# Altium schematic sheet STM32.SchDoc
size A4; SheetNumber: 3; SheetTotal: 9
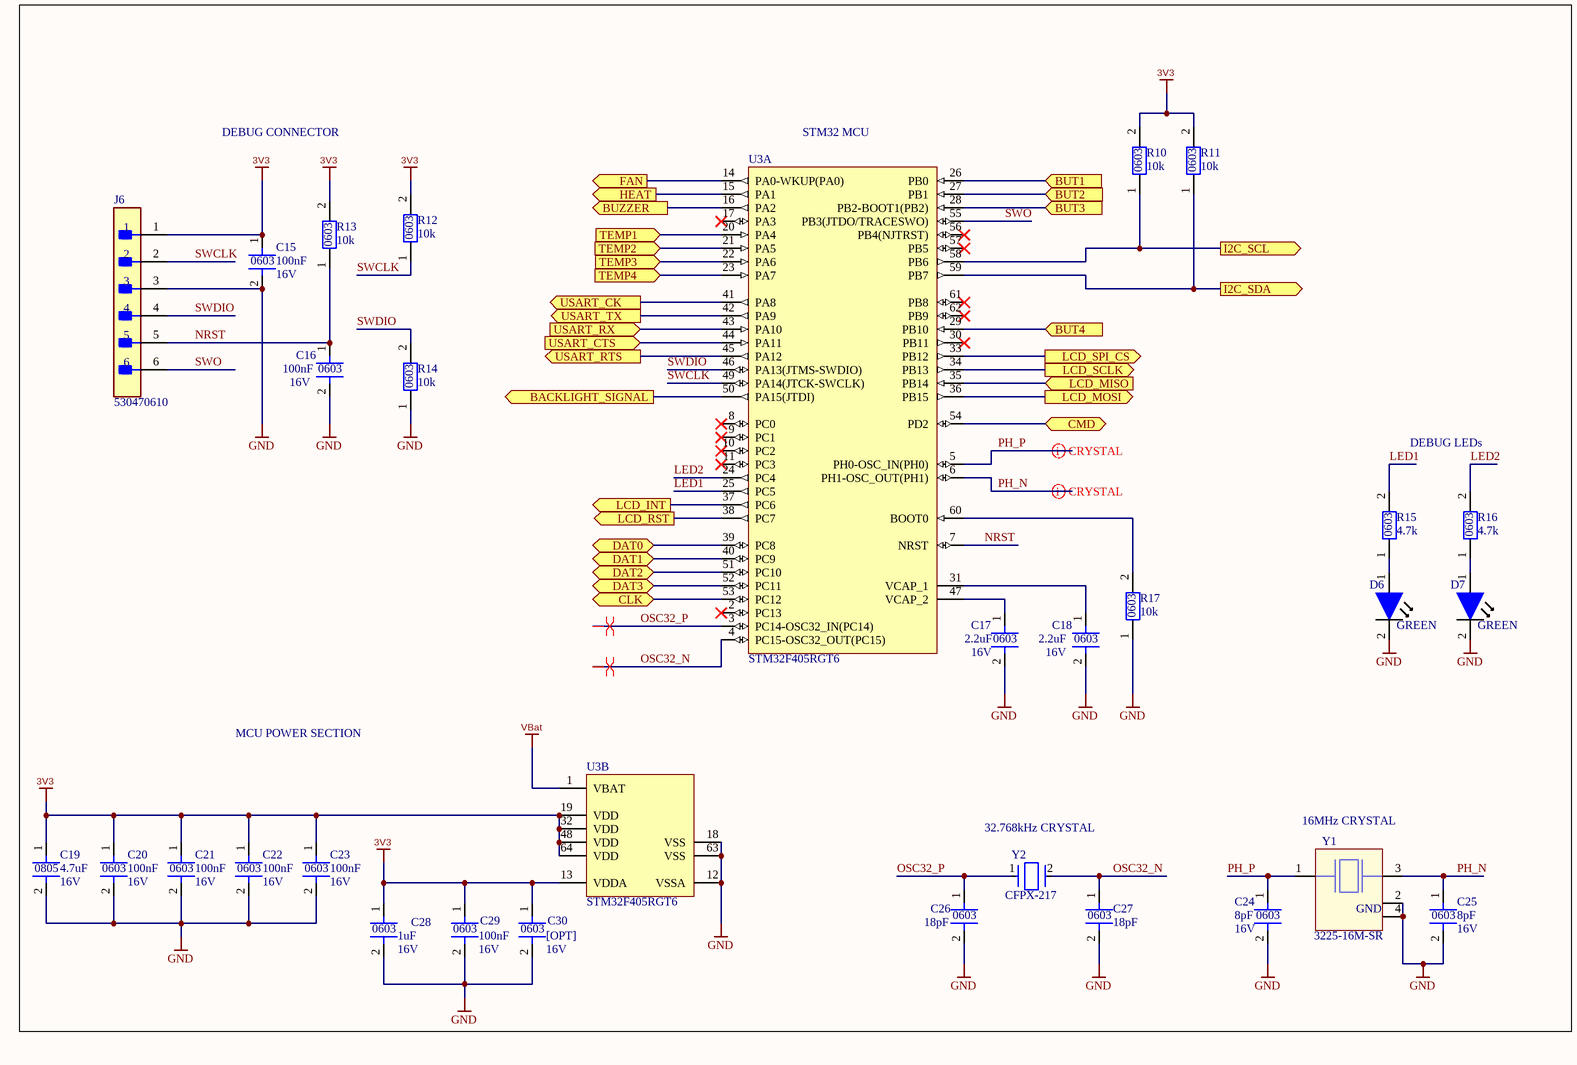
[diagram p0: STM32.SchDoc]

## Parts
C15  SMD 0603 Capacitor  [CAPACITOR_SMD_0603]  (value not drawn)
C16  SMD 0603 Capacitor  [CAPACITOR_SMD_0603]  (value not drawn)
C17  SMD 0603 Capacitor  [CAPACITOR_SMD_0603]  (value not drawn)
C18  SMD 0603 Capacitor  [CAPACITOR_SMD_0603]  (value not drawn)
C19  SMD 0805 Capacitor  [CAPACITOR_SMD_0805_IPC]  (value not drawn)
C20  SMD 0603 Capacitor  [CAPACITOR_SMD_0603]  (value not drawn)
C21  SMD 0603 Capacitor  [CAPACITOR_SMD_0603]  (value not drawn)
C22  SMD 0603 Capacitor  [CAPACITOR_SMD_0603]  (value not drawn)
C23  SMD 0603 Capacitor  [CAPACITOR_SMD_0603]  (value not drawn)
C24  SMD 0603 Capacitor  [CAPACITOR_SMD_0603]  (value not drawn)
C25  SMD 0603 Capacitor  [CAPACITOR_SMD_0603]  (value not drawn)
C26  SMD 0603 Capacitor  [CAPACITOR_SMD_0603]  (value not drawn)
C27  SMD 0603 Capacitor  [CAPACITOR_SMD_0603]  (value not drawn)
C28  SMD 0603 Capacitor  [CAPACITOR_SMD_0603]  (value not drawn)
C29  SMD 0603 Capacitor  [CAPACITOR_SMD_0603]  (value not drawn)
C30  SMD 0603 Capacitor  [CAPACITOR_SMD_0603]  (value not drawn)
D6  SMD LED 0603  [0603 LED]  (value not drawn)
D7  SMD LED 0603  [0603 LED]  (value not drawn)
J6  530470610  [FP-530470610-MFG]
R10  SMD 0603 Resistor  [RESISTOR_SMD_0603]  (value not drawn)
R11  SMD 0603 Resistor  [RESISTOR_SMD_0603]  (value not drawn)
R12  SMD 0603 Resistor  [RESISTOR_SMD_0603]  (value not drawn)
R13  SMD 0603 Resistor  [RESISTOR_SMD_0603]  (value not drawn)
R14  SMD 0603 Resistor  [RESISTOR_SMD_0603]  (value not drawn)
R15  SMD 0603 Resistor  [RESISTOR_SMD_0603]  (value not drawn)
R16  SMD 0603 Resistor  [RESISTOR_SMD_0603]  (value not drawn)
R17  SMD 0603 Resistor  [RESISTOR_SMD_0603]  (value not drawn)
U3  STM32F405RGT6  [STM-LQFP64_V]  (parts A,B of 2)
Y1  3225-16M-SR  [3225-16M-SR]
Y2  CFPX-217  [FP-ABS07-MFG]

## Ports
BACKLIGHT_SIGNAL (out, see MAIN_SCHEMATIC[3B], 3V3_5V_LEVEL_SHIFTER[1B]), BUT1 (in, see MAIN_SCHEMATIC[2B], BUTTONS[3A]), BUT2 (in, see MAIN_SCHEMATIC[2B], BUTTONS[3B]), BUT3 (in, see MAIN_SCHEMATIC[2C], BUTTONS[3C]), BUT4 (in, see MAIN_SCHEMATIC[2C], BUTTONS[3D]), BUZZER (out, see MAIN_SCHEMATIC[3C], BUZZER[2C]), CLK (bidir, see MAIN_SCHEMATIC[3C], SD_CARD[2C]), CMD (bidir, see MAIN_SCHEMATIC[3C], SD_CARD[2C]), DAT0 (bidir, see MAIN_SCHEMATIC[3C], SD_CARD[2C]), DAT1 (bidir, see MAIN_SCHEMATIC[3C], SD_CARD[2C]), DAT2 (bidir, see MAIN_SCHEMATIC[3C], SD_CARD[2B]), DAT3 (bidir, see MAIN_SCHEMATIC[3C], SD_CARD[2B]), FAN (out, see MAIN_SCHEMATIC[3C], SR40A[1D]), HEAT (out, see MAIN_SCHEMATIC[3C], SR40A[1B]), I2C_SCL (out, see MAIN_SCHEMATIC[3D]), I2C_SDA (out, see MAIN_SCHEMATIC[3D]), LCD_INT (out, see MAIN_SCHEMATIC[3B]), LCD_MISO (in, see MAIN_SCHEMATIC[3B]), LCD_MOSI (out, see MAIN_SCHEMATIC[3B]), LCD_RST (out, see MAIN_SCHEMATIC[3B]), LCD_SCLK (out, see MAIN_SCHEMATIC[3B]), LCD_SPI_CS (out, see MAIN_SCHEMATIC[3B]), TEMP1 (in, see MAIN_SCHEMATIC[2C], PT1000[6A]), TEMP2 (in, see MAIN_SCHEMATIC[2C], PT1000[6B]), TEMP3 (in, see MAIN_SCHEMATIC[2C], PT1000[6C]), TEMP4 (in, see MAIN_SCHEMATIC[2D], PT1000[6D]), USART_CK (out, see MAIN_SCHEMATIC[3D]), USART_CTS (in, see MAIN_SCHEMATIC[3D]), USART_RTS (out, see MAIN_SCHEMATIC[3D]), USART_RX (in, see MAIN_SCHEMATIC[3D]), USART_TX (out, see MAIN_SCHEMATIC[3D])

## Nets
3V3: C15.1 C19.1 C20.1 C21.1 C22.1 C23.1 C28.1 C29.1 C30.1 J6.1 R10.2 R11.2 R12.2 R13.2 U3.13(VDDA) U3.19(VDD) U3.32(VDD) U3.48(VDD) U3.64(VDD)
GND: C15.2 C16.2 C17.2 C18.2 C19.2 C20.2 C21.2 C22.2 C23.2 C24.2 C25.2 C26.2 C27.2 C28.2 C29.2 C30.2 D6.2 D7.2 J6.3 R14.1 R17.1 U3.12(VSSA) U3.18(VSS) U3.63(VSS) Y1.2 Y1.4
VBat: U3.1(VBAT)
BACKLIGHT_SIGNAL: U3.50(PA15(JTDI)) ; port BACKLIGHT_SIGNAL
BUT1: U3.26(PB0) ; port BUT1
BUT2: U3.27(PB1) ; port BUT2
BUT3: U3.28(PB2-BOOT1(PB2)) ; port BUT3
BUT4: U3.29(PB10) ; port BUT4
BUZZER: U3.16(PA2) ; port BUZZER
CLK: U3.53(PC12) ; port CLK
CMD: U3.54(PD2) ; port CMD
DAT0: U3.39(PC8) ; port DAT0
DAT1: U3.40(PC9) ; port DAT1
DAT2: U3.51(PC10) ; port DAT2
DAT3: U3.52(PC11) ; port DAT3
FAN: U3.14(PA0-WKUP(PA0)) ; port FAN
HEAT: U3.15(PA1) ; port HEAT
I2C_SCL: R10.1 U3.58(PB6) ; port I2C_SCL
I2C_SDA: R11.1 U3.59(PB7) ; port I2C_SDA
LCD_INT: U3.37(PC6) ; port LCD_INT
LCD_MISO: U3.35(PB14) ; port LCD_MISO
LCD_MOSI: U3.36(PB15) ; port LCD_MOSI
LCD_RST: U3.38(PC7) ; port LCD_RST
LCD_SCLK: U3.34(PB13) ; port LCD_SCLK
LCD_SPI_CS: U3.33(PB12) ; port LCD_SPI_CS
LED1: R15.2 U3.25(PC5)
LED2: R16.2 U3.24(PC4)
NRST: C16.1 J6.5 R13.1 U3.7(NRST)
OSC32_N: C27.1 U3.4(PC15-OSC32_OUT(PC15)) Y2.2
OSC32_P: C26.1 U3.3(PC14-OSC32_IN(PC14)) Y2.1
PH_N: C25.1 U3.6(PH1-OSC_OUT(PH1)) Y1.3
PH_P: C24.1 U3.5(PH0-OSC_IN(PH0)) Y1.1
SWCLK: J6.2 R12.1 U3.49(PA14(JTCK-SWCLK))
SWDIO: J6.4 R14.2 U3.46(PA13(JTMS-SWDIO))
SWO: J6.6 U3.55(PB3(JTDO/TRACESWO))
TEMP1: U3.20(PA4) ; port TEMP1
TEMP2: U3.21(PA5) ; port TEMP2
TEMP3: U3.22(PA6) ; port TEMP3
TEMP4: U3.23(PA7) ; port TEMP4
USART_CK: U3.41(PA8) ; port USART_CK
USART_CTS: U3.44(PA11) ; port USART_CTS
USART_RTS: U3.45(PA12) ; port USART_RTS
USART_RX: U3.43(PA10) ; port USART_RX
USART_TX: U3.42(PA9) ; port USART_TX
NetC17_1: C17.1 U3.47(VCAP_2)
NetC18_1: C18.1 U3.31(VCAP_1)
NetD6_1: D6.1 R15.1
NetD7_1: D7.1 R16.1
NetR17_2: R17.2 U3.60(BOOT0)

Not connected (* = marked no-connect by the designer): U3 2(PC13)* 8(PC0)* 9(PC1)* 10(PC2)* 11(PC3)* 17(PA3)* 30(PB11)* 56(PB4(NJTRST))* 57(PB5)* 61(PB8)* 62(PB9)*

## Layout directives
differential pair: OSC32_N, OSC32_P, PH_N, PH_P

## Notes on the sheet
- DEBUG CONNECTOR
- (near U3) STM32 MCU
- (near R10) 10k
- (near R11) 10k
- (near R13) 10k
- (near R12) 10k
- (near C15) 100nF
- (near C15) 16V
- (near C16) 100nF
- (near C16) 16V
- (near R14) 10k
- DEBUG LEDs
- (near R15) 4.7k
- (near R16) 4.7k
- (near C17) 2.2uF
- (near C17) 16V
- (near C18) 2.2uF
- (near C18) 16V
- (near R17) 10k
- (near D6) GREEN
- (near D7) GREEN
- MCU POWER SECTION
- (near Y2) 32.768kHz CRYSTAL
- (near Y1) 16MHz CRYSTAL
- 4.7uF
- (near C19) 16V
- 100nF
- (near C20) 16V
- (near C21) 16V
- (near C22) 16V
- (near C23) 100nF
- (near C23) 16V
- (near C26) 18pF
- (near C27) 18pF
- (near C24) 8pF
- (near C25) 8pF
- (near C28) 16V
- (near C28) 1uF
- (near C29) 16V
- (near C30) [OPT]
- (near C30) 16V
- (near C24) 16V
- (near C25) 16V
- (in symbol Crystal) GND
- (in symbol SMD 0603 Capacitor) 0603
- (in symbol SMD 0603 Resistor) 0603
- (in symbol SMD 0805 Capacitor) 0805

## Library data of the parts
C15-C18 C20-C30 = SMD 0603 Capacitor: 0603 capacitor
D6 D7 = SMD LED 0603: 0603 LED
J6 = CMP-2000-05476-3: CONN HEADER VERT 6POS 1.25MM; Manufacturer: Molex; Conn Gender: Male; Voltage Rating: 125V; Number Of Contacts: 6; Current Rating: 1A; Conn Orientation: Vertical; Number Of Rows: 1; Package: 0; Height: 4.4mm; Device Class L2: Headers and Wire Housings; RoHS: TRUE; Pitch: 1.25mm; Category: Conn; Device Class L1: Connectors; ComponentLink2URL: https://www.molex.com/webdocs/datasheets/pdf/en-us/0530470610_PCB_HEADERS.pdf; Temperature Range Low: -40°C; Temperature: -40°C to +85°C; Lead Free: Yes; Footprint Url: https://www.molex.com/pdm_docs/sd/530470610_sd.pdf; Temperature Range High: +85°C; Device Class L3: unset; Digikey Description: CONN HEADER VERT 6POS 1.25MM; Automotive: No; Mouser Description: Headers & Wire Housings VERTICAL HDR 6P; ComponentLink2Description: Datasheet; Contact Material: Tin; Manufacturer Part Number: 530470610; Octopart: https://octopart.com/53047-0610-molex-276776
R10-R17 = SMD 0603 Resistor: 0603 resistor
U3 = CMP-0243-00019-3: ARM Cortex-M4 32-bit MCU+FPU, 210 DMIPS, 1024 kB Flash, 192 kB Internal RAM, 51 I/Os, 64-pin LQFP, -40 to 85 degC, Tray; Manufacturer: STMicroelectronics; Supply Voltage(Vcc) min (V): 1.8; Supply Voltage(Vcc) max (V): 3.6; Internal RAM Size (kB): 192; I/Os (High Current): 51; D/A Converter: 2x12-bit; FLASH Size (Prog) (kB): 1024; Operating Frequency(F) (Processor speed) (MHz): 168; ComponentLink2Description: Datasheet; PackageVersion: Rev. 4, 06/2013; DatasheetVersion: Rev. 4; Core: ARM Cortex-M4; ComponentLink2URL: http://www.st.com/st-web-ui/static/active/en/resource/technical/document/datasheet/DM00037051.pdf; PackageReference: LQFP64; Packing: Tray; ComponentLink1Description: Manufacturer URL; ComponentLink3URL: http://www.st.com/st-web-ui/static/active/en/resource/technical/document/datasheet/DM00037051.pdf; ComponentLink3Description: Package Specification; Mounting Technology: Surface Mount; ComponentLink1URL: http://www.st.com/web/en/home.html; PackageDescription: 64-Pin Low Profile Quad Flat Package, 10 x 10 mm Body, 0.5 mm Pitch; PartNumber: STM32F405RGT6
Y1 = Crystal: SMD 16MHz crystal
Y2 = Crystal 32.768kHz: Crystal 32.768kHz 3.2mm x 1.5mm; ESR (Equivalent Series Resistance): 50kR; Load Capacitance: 6pF; Frequency Tolerance: 20ppm; Frequency: 32.768kHz; RoHS Compliant: Yes; Case/Package: SMD/SMT; Max Operating Temperature: 85°C; Series: ABS07-LR; Min Operating Temperature: -40°C; Packaging: Cut Tape; Height: 0.035inch; Width: 0.061inch; Length: 0.126inch; Mount: Surface Mount